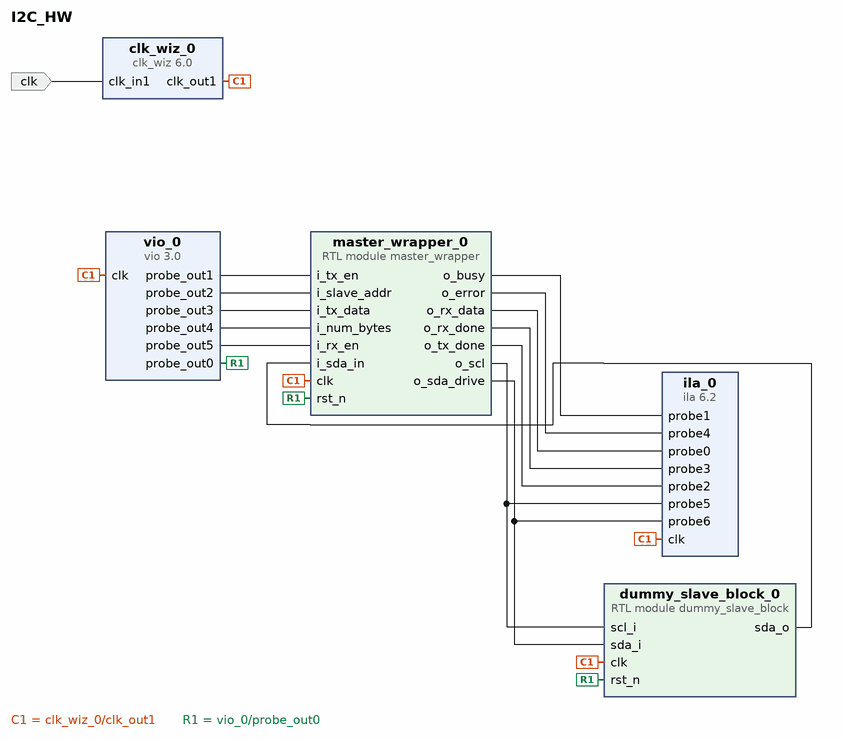
[diagram p0: block diagram of the top level]
# Vivado block design I2C_HW, xc7a35tcpg236-1, Vivado 2025.2
create_bd_design I2C_HW

create_bd_port -dir I -type clk clk
set_property -dict {CONFIG.CLK_DOMAIN I2C_HW_clk CONFIG.FREQ_HZ 100000000} [get_bd_ports clk]

create_bd_cell -type ip -vlnv xilinx.com:ip:vio:3.0 vio_0
set_property -dict [list \
  CONFIG.C_NUM_PROBE_IN 0 \
  CONFIG.C_NUM_PROBE_OUT 6 \
  CONFIG.C_PROBE_OUT2_WIDTH 7 \
  CONFIG.C_PROBE_OUT3_WIDTH 32 \
  CONFIG.C_PROBE_OUT4_WIDTH 3 \
] [get_bd_cells vio_0]
create_bd_cell -type ip -vlnv xilinx.com:ip:ila:6.2 ila_0
set_property -dict [list \
  CONFIG.C_DATA_DEPTH 32768 \
  CONFIG.C_MONITOR_TYPE Native \
  CONFIG.C_NUM_OF_PROBES 7 \
  CONFIG.C_PROBE0_WIDTH 32 \
] [get_bd_cells ila_0]
create_bd_cell -type module -reference master_wrapper master_wrapper_0
create_bd_cell -type module -reference dummy_slave_block dummy_slave_block_0
create_bd_cell -type ip -vlnv xilinx.com:ip:clk_wiz:6.0 clk_wiz_0
set_property -dict {CONFIG.USE_RESET false} [get_bd_cells clk_wiz_0]

# ---- connections ----

connect_bd_net [get_bd_ports clk] [get_bd_pins clk_wiz_0/clk_in1]
connect_bd_net [get_bd_pins clk_wiz_0/clk_out1] \
  [get_bd_pins ila_0/clk] [get_bd_pins vio_0/clk] [get_bd_pins master_wrapper_0/clk] [get_bd_pins dummy_slave_block_0/clk]
connect_bd_net [get_bd_pins dummy_slave_block_0/sda_o] [get_bd_pins master_wrapper_0/i_sda_in]
connect_bd_net [get_bd_pins master_wrapper_0/o_busy] [get_bd_pins ila_0/probe1]
connect_bd_net [get_bd_pins master_wrapper_0/o_error] [get_bd_pins ila_0/probe4]
connect_bd_net [get_bd_pins master_wrapper_0/o_rx_data] [get_bd_pins ila_0/probe0]
connect_bd_net [get_bd_pins master_wrapper_0/o_rx_done] [get_bd_pins ila_0/probe3]
connect_bd_net [get_bd_pins master_wrapper_0/o_scl] [get_bd_pins ila_0/probe5] [get_bd_pins dummy_slave_block_0/scl_i]
connect_bd_net [get_bd_pins master_wrapper_0/o_sda_drive] [get_bd_pins ila_0/probe6] [get_bd_pins dummy_slave_block_0/sda_i]
connect_bd_net [get_bd_pins master_wrapper_0/o_tx_done] [get_bd_pins ila_0/probe2]
connect_bd_net [get_bd_pins vio_0/probe_out0] [get_bd_pins master_wrapper_0/rst_n] [get_bd_pins dummy_slave_block_0/rst_n]
connect_bd_net [get_bd_pins vio_0/probe_out1] [get_bd_pins master_wrapper_0/i_tx_en]
connect_bd_net [get_bd_pins vio_0/probe_out2] [get_bd_pins master_wrapper_0/i_slave_addr]
connect_bd_net [get_bd_pins vio_0/probe_out3] [get_bd_pins master_wrapper_0/i_tx_data]
connect_bd_net [get_bd_pins vio_0/probe_out4] [get_bd_pins master_wrapper_0/i_num_bytes]
connect_bd_net [get_bd_pins vio_0/probe_out5] [get_bd_pins master_wrapper_0/i_rx_en]

validate_bd_design
save_bd_design
